# EAGLE schematic cpu1 (EAGLE 4.13)
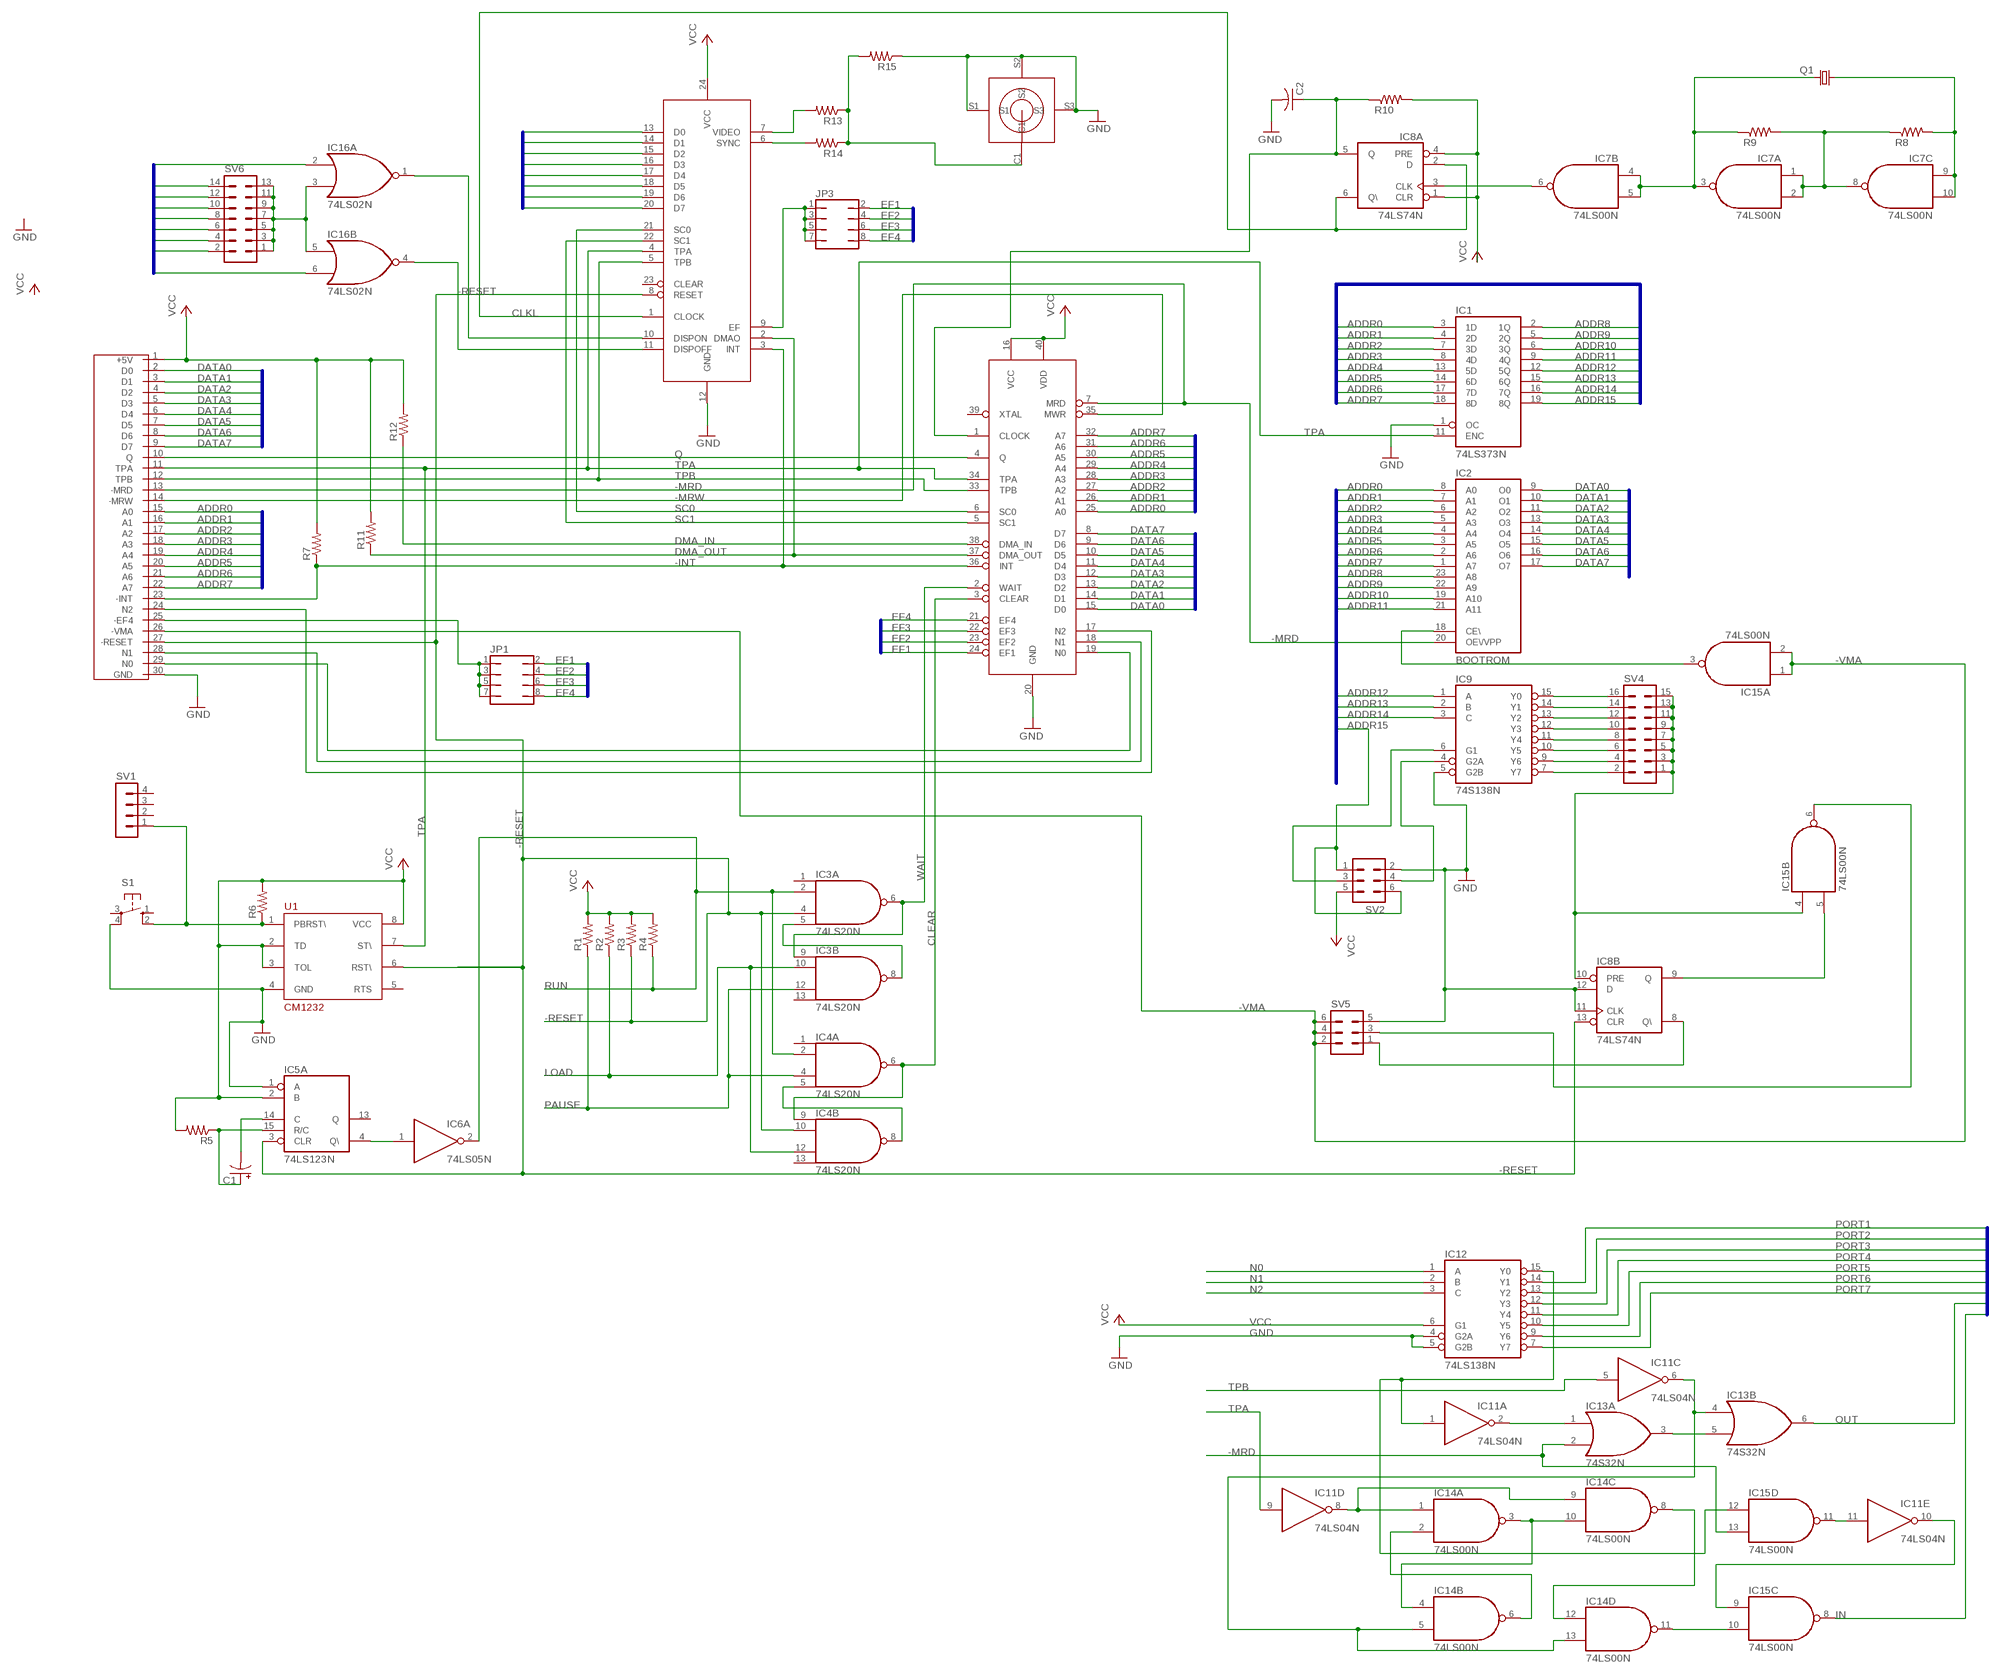
[diagram p0: schematic, sheet 1]

## Parts
C1  CPOL-USE2.5-7  [E2,5-7]
C2  C-US025-025X050  [C025-025X050]
IC1  74LS373N  [DIL20]
IC2  BOOTROM  2732  [DIL24]
IC3  74LS20N  [DIL14]
IC4  74LS20N  [DIL14]
IC5  74LS123N  [DIL16]
IC6  74LS05N  [DIL14]
IC7  74LS00N  [DIL14]
IC8  74LS74N  [DIL14]
IC9  74S138N  [DIL16]
IC11  74LS04N  [DIL14]
IC12  74LS138N  [DIL16]
IC13  74S32N  [DIL14]
IC14  74LS00N  [DIL14]
IC15  74LS00N  [DIL14]
IC16  74LS02N  [DIL14]
JP1  JP4Q  [JP4Q]
JP3  JP4Q  [JP4Q]
Q1  CRYTALHC49U70  [HC49U70]
R1  R-US_0207/2V  [0207/2V]
R2  R-US_0207/2V  [0207/2V]
R3  R-US_0207/2V  [0207/2V]
R4  R-US_0207/2V  [0207/2V]
R5  R-US_0207/2V  [0207/2V]
R6  R-US_0207/2V  [0207/2V]
R7  R-US_0207/2V  [0207/2V]
R8  R-US_0207/2V  [0207/2V]
R9  R-US_0207/2V  [0207/2V]
R10  R-US_0207/2V  [0207/2V]
R11  R-US_0207/2V  [0207/2V]
R12  R-US_0207/2V  [0207/2V]
R13  R-US_0207/2V  [0207/2V]
R14  R-US_0207/2V  [0207/2V]
R15  R-US_0207/2V  [0207/2V]
S1  10-XX  [B3F-10XX]
SV1  MA04-1  [MA04-1]
SV2  MA03-2  [MA03-2]
SV4  MA08-2  [MA08-2]
SV5  MA03-2  [MA03-2]
SV6  MA07-2  [MA07-2]
U1  CM1232  [DIP-8]
U$1  CDP1802BCECDP1802BCE  [DIL40]
U$2  C30  [C30]
U$3  CDP1861  [DIP24]
U$4  RCA  [RCA]

## Nets
-EF1: JP3.1 JP3.3 JP3.5 JP3.7 U$3.9(EF)
-EF4: JP1.1 JP1.3 JP1.5 JP1.7 U$2.25(-EF4)
-INT: R7.1 U$1.36(INT) U$2.23(-INT) U$3.3(INT)
-MRD: IC2.20(OE\/VPP) IC13.2(A:I1) IC15.13(D:I1) U$1.7(MRD) U$2.13(-MRD)
-MRW: U$1.35(MWR) U$2.14(-MRW)
-RESET: IC3.4(A:I2) IC4.10(B:I1) IC5.3(A:CLR) IC8.13(B:CLR) R3.1 U1.6(RST\) U$2.27(-RESET) U$3.8(RESET)
-VMA: IC15.1(A:I0) IC15.2(A:I1) SV5.2 SV5.4 SV5.6 U$2.26(-VMA)
ADDR0: IC1.3(1D) IC2.8(A0) U$1.25(A0) U$2.15(A0)
ADDR1: IC1.4(2D) IC2.7(A1) U$1.26(A1) U$2.16(A1)
ADDR2: IC1.7(3D) IC2.6(A2) U$1.27(A2) U$2.17(A2)
ADDR3: IC1.8(4D) IC2.5(A3) U$1.28(A3) U$2.18(A3)
ADDR4: IC1.13(5D) IC2.4(A4) U$1.29(A4) U$2.19(A4)
ADDR5: IC1.14(6D) IC2.3(A5) U$1.30(A5) U$2.20(A5)
ADDR6: IC1.17(7D) IC2.2(A6) U$1.31(A6) U$2.21(A6)
ADDR7: IC1.18(8D) IC2.1(A7) U$1.32(A7) U$2.22(A7)
ADDR8: IC1.2(1Q) IC2.23(A8)
ADDR9: IC1.5(2Q) IC2.22(A9)
ADDR10: IC1.6(3Q) IC2.19(A10)
ADDR11: IC1.9(4Q) IC2.21(A11)
ADDR12: IC1.12(5Q) IC9.1(A)
ADDR13: IC1.15(6Q) IC9.2(B)
ADDR14: IC1.16(7Q) IC9.3(C)
ADDR15: IC1.19(8Q) SV2.1 SV2.6
CLEAR: IC4.6(A:O) IC4.9(B:I0) U$1.3(CLEAR)
CLKL: IC8.2(A:D) IC8.6(A:Q\) U$3.1(CLOCK)
DATA0: IC2.9(O0) U$1.15(D0) U$2.2(D0) U$3.13(D0)
DATA1: IC2.10(O1) U$1.14(D1) U$2.3(D1) U$3.14(D1)
DATA2: IC2.11(O2) U$1.13(D2) U$2.4(D2) U$3.15(D2)
DATA3: IC2.13(O3) U$1.12(D3) U$2.5(D3) U$3.16(D3)
DATA4: IC2.14(O4) U$1.11(D4) U$2.6(D4) U$3.17(D4)
DATA5: IC2.15(O5) U$1.10(D5) U$2.7(D5) U$3.18(D5)
DATA6: IC2.16(O6) U$1.9(D6) U$2.8(D6) U$3.19(D6)
DATA7: IC2.17(O7) U$1.8(D7) U$2.9(D7) U$3.20(D7)
DMA_IN: R12.1 U$1.38(DMA_IN)
DMA_OUT: R11.1 U$1.37(DMA_OUT) U$3.2(DMAO)
EF1: JP1.2 JP3.2 U$1.24(EF1)
EF2: JP1.4 JP3.4 U$1.23(EF2)
EF3: JP1.6 JP3.6 U$1.22(EF3)
EF4: JP1.8 JP3.8 U$1.21(EF4)
GND: C2.2 IC1.1(OC) IC5.1(A:A) IC8.11(B:CLK) IC8.12(B:D) IC9.5(G2B) IC12.4(G2A) IC12.5(G2B) R15.1 S1.4(P1) SV2.2 SV5.5 U1.4(GND) U$1.20(GND) U$2.30(GND) U$3.12(GND) U$4.S1 U$4.S2 U$4.S3
IN: IC15.8(C:O) IC16.2(A:I0)
LOAD: IC3.10(B:I1) IC4.12(B:I2) R2.1
N0: IC12.1(A) U$1.19(N0) U$2.29(N0)
N1: IC12.2(B) U$1.18(N1) U$2.28(N1)
N2: IC12.3(C) U$1.17(N2) U$2.24(N2)
N$1: IC15.6(B:O) SV5.3
N$2: R6.1 S1.2(S1) SV1.1 U1.1(PBRST\)
N$3: IC2.18(CE\) IC15.3(A:O)
N$4: IC8.9(B:Q) IC15.5(B:I1)
N$5: IC11.1(A:I) IC12.15(Y0) IC15.12(D:I0)
N$6: IC8.8(B:Q\) SV5.1
N$7: R14.2 U$3.6(SYNC)
N$8: R13.2 U$3.7(VIDEO)
N$9: R13.1 R14.1 R15.2 U$4.C1
N$10: IC11.2(A:O) IC13.1(A:I0)
N$11: IC13.3(A:O) IC13.5(B:I1)
N$12: IC14.3(A:O) IC14.4(B:I0) IC14.10(C:I1)
N$13: IC14.2(A:I1) IC14.6(B:O)
N$14: IC11.8(D:O) IC14.1(A:I0) IC14.9(C:I0)
N$15: IC5.4(A:Q\) IC6.1(A:I)
N$16: IC7.1(A:I0) IC7.2(A:I1) IC7.8(C:O) R8.1 R9.2
N$17: C1.+ IC5.15(A:R/C) R5.1
N$18: IC7.3(A:O) IC7.4(B:I0) IC7.5(B:I1) Q1.2 R9.1
N$19: C1.- IC5.14(A:C)
N$20: IC9.4(G2A) SV2.4
N$21: IC7.9(C:I0) IC7.10(C:I1) Q1.1 R8.2
N$22: IC3.5(A:I3) IC3.8(B:O)
N$23: IC7.6(B:O) IC8.3(A:CLK)
N$24: IC4.5(A:I3) IC4.8(B:O)
N$26: IC14.8(C:O) IC14.12(D:I0)
N$27: C2.1 IC8.5(A:Q) R10.1 U$1.1(CLOCK)
N$28: IC11.6(C:O) IC13.4(B:I0) IC14.5(B:I1) IC14.13(D:I1)
N$29: IC9.15(Y0) SV4.16
N$30: IC9.14(Y1) SV4.14
N$31: IC9.13(Y2) SV4.12
N$32: IC9.12(Y3) SV4.10
N$33: IC9.11(Y4) SV4.8
N$34: IC9.10(Y5) SV4.6
N$35: IC9.9(Y6) SV4.4
N$36: IC9.7(Y7) SV4.2
N$37: IC8.10(B:PRE) IC15.4(B:I0) SV4.1 SV4.3 SV4.5 SV4.7 SV4.9 SV4.11 SV4.13 SV4.15
N$38: IC9.6(G1) SV2.3
N$39: IC14.11(D:O) IC15.10(C:I1)
N$40: IC11.10(E:O) IC15.9(C:I0)
N$41: IC11.11(E:I) IC15.11(D:O)
N$42: IC16.3(A:I1) IC16.5(B:I0) SV6.1 SV6.3 SV6.5 SV6.7 SV6.9 SV6.11 SV6.13
N$43: IC16.1(A:O) U$3.10(DISPON)
N$44: IC16.4(B:O) U$3.11(DISPOFF)
OUT: IC13.6(B:O) IC16.6(B:I1)
PAUSE: IC3.12(B:I2) IC4.4(A:I2) R1.1
PORT1: IC12.14(Y1) SV6.14
PORT2: IC12.13(Y2) SV6.12
PORT3: IC12.12(Y3) SV6.10
PORT4: IC12.11(Y4) SV6.8
PORT5: IC12.10(Y5) SV6.6
PORT6: IC12.9(Y6) SV6.4
PORT7: IC12.7(Y7) SV6.2
Q: U$1.4(Q) U$2.10(Q)
RUN: IC3.2(A:I1) IC4.2(A:I1) IC6.2(A:O) R4.1
SC0: U$1.6(SC0) U$3.21(SC0)
SC1: U$1.5(SC1) U$3.22(SC1)
TPA: IC1.11(ENC) IC11.9(D:I) U1.7(ST\) U$1.34(TPA) U$2.11(TPA) U$3.4(TPA)
TPB: IC11.5(C:I) U$1.33(TPB) U$2.12(TPB) U$3.5(TPB)
VCC: IC5.2(A:B) IC8.1(A:CLR) IC8.4(A:PRE) IC12.6(G1) R1.2 R2.2 R3.2 R4.2 R5.2 R6.2 R7.2 R10.2 R11.2 R12.2 SV2.5 U1.2(TD) U1.3(TOL) U1.8(VCC) U$1.16(VCC) U$1.40(VDD) U$2.1(+5V) U$3.24(VCC)
WAIT: IC3.6(A:O) IC3.9(B:I0) U$1.2(WAIT)
Unconnected: IC3.1(A:I0) IC3.13(B:I3) IC4.1(A:I0) IC4.13(B:I3) IC5.5(B:Q) IC5.6(B:C) IC5.7(B:R/C) IC5.9(B:A) IC5.10(B:B) IC5.11(B:CLR) IC5.12(B:Q\) IC5.13(A:Q) IC6.3(B:I) IC6.4(B:O) IC6.5(C:I) IC6.6(C:O) IC6.8(D:O) IC6.9(D:I) IC6.10(E:O) IC6.11(E:I) IC6.12(F:O) IC6.13(F:I) IC7.11(D:O) IC7.12(D:I0) IC7.13(D:I1) IC11.3(B:I) IC11.4(B:O) IC11.12(F:O) IC11.13(F:I) IC13.8(C:O) IC13.9(C:I0) IC13.10(C:I1) IC13.11(D:O) IC13.12(D:I0) IC13.13(D:I1) IC16.8(C:I0) IC16.9(C:I1) IC16.10(C:O) IC16.11(D:I0) IC16.12(D:I1) IC16.13(D:O) S1.1(S) S1.3(P) SV1.2 SV1.3 SV1.4 U1.5(RTS) U$1.39(XTAL) U$3.23(CLEAR)

## Buses
DATA[0..7]
ADDR[0..15]
EF[1..4]
PORT[1..7],IN,OUT

## Power pins joined to a net without a drawn wire
GND: IC1.10(GND) IC2.12(GND) IC3.7(P:GND) IC4.7(P:GND) IC5.8(P:GND) IC6.7(P:GND) IC7.7(P:GND) IC8.7(P:GND) IC9.8(GND) IC11.7(P:GND) IC12.8(GND) IC13.7(P:GND) IC14.7(P:GND) IC15.7(P:GND) IC16.7(P:GND)
VCC: IC1.20(VCC) IC2.24(VCC) IC3.14(P:VCC) IC4.14(P:VCC) IC5.16(P:VCC) IC6.14(P:VCC) IC7.14(P:VCC) IC8.14(P:VCC) IC9.16(VCC) IC11.14(P:VCC) IC12.16(VCC) IC13.14(P:VCC) IC14.14(P:VCC) IC15.14(P:VCC) IC16.14(P:VCC)

## Library data of the parts
C1 = rcl:CPOL-US: POLARIZED CAPACITOR, American symbol
C2 = rcl:C-US: CAPACITOR, American symbol
IC1 = 74xx-us:74*373: Octal D type transparent LATCH, edge triggered
IC2 = memory:2732: MEMORY
IC3 IC4 = 74xx-us:74*20: Dual 4-input NAND gate
IC5 = 74xx-us:74*123: Retriggerable monostable MULTIVIBRATOR
IC6 = 74xx-us:74*05: Hex INVERTER, open collector
IC7 IC14 IC15 = 74xx-us:74*00: Quad 2-input NAND gate
IC8 = 74xx-us:74*74: Dual D type positive edge triggered FLIP FLOP, preset and clear
IC9 IC12 = 74xx-us:74*138: 3-line to 8-line DECODER/DEMULTIPLEXER
IC11 = 74xx-us:74*04: Hex INVERTER
IC13 = 74xx-us:74*32: Quad 2-input OR gate
IC16 = 74xx-us:74*02: Quad 2-input NOR gate
JP1 JP3 = jumper:JP4Q: JUMPER
Q1 = crystal:CRYTAL: CRYSTAL
R1-R15 = rcl:R-US_: RESISTOR, American symbol
S1 = switch-omron:10-XX: OMRON SWITCH
SV1 = con-lstb:MA04-1: PIN HEADER
SV2 SV5 = con-lstb:MA03-2: PIN HEADER
SV4 = con-lstb:MA08-2: PIN HEADER
SV6 = con-lstb:MA07-2: PIN HEADER
U1 = 65xxx:CM1232: CM1232 CMOS Microprocessor Monitor
U$1 = cdp:CDP1802BCE
U$2 = k1:C30
U$3 = cdp:CDP1861
U$4 = cdp:RCA